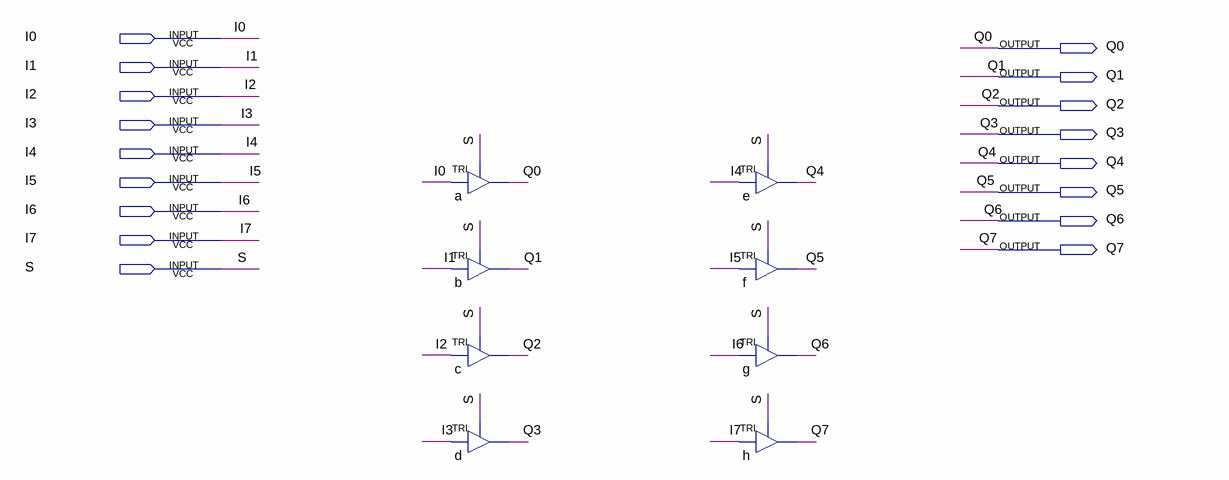
[diagram p0: schematic sheet]
// Quartus schematic tri8b.bdf as structural Verilog: 8 symbols, 17 pins
module tri8b (
  input  I0,
  input  I1,
  input  I2,
  input  I3,
  input  I4,
  input  I5,
  input  I6,
  input  I7,
  input  S,
  output Q0,
  output Q1,
  output Q2,
  output Q3,
  output Q4,
  output Q5,
  output Q6,
  output Q7
);

  TRI a (.IN(I0), .OE(S), .OUT(Q0));
  TRI b (.IN(I1), .OE(S), .OUT(Q1));
  TRI c (.IN(I2), .OE(S), .OUT(Q2));
  TRI d (.IN(I3), .OE(S), .OUT(Q3));
  TRI e (.IN(I4), .OE(S), .OUT(Q4));
  TRI f (.IN(I5), .OE(S), .OUT(Q5));
  TRI g (.IN(I6), .OE(S), .OUT(Q6));
  TRI h (.IN(I7), .OE(S), .OUT(Q7));
endmodule
